# Altium project pca20057.PrjPCB
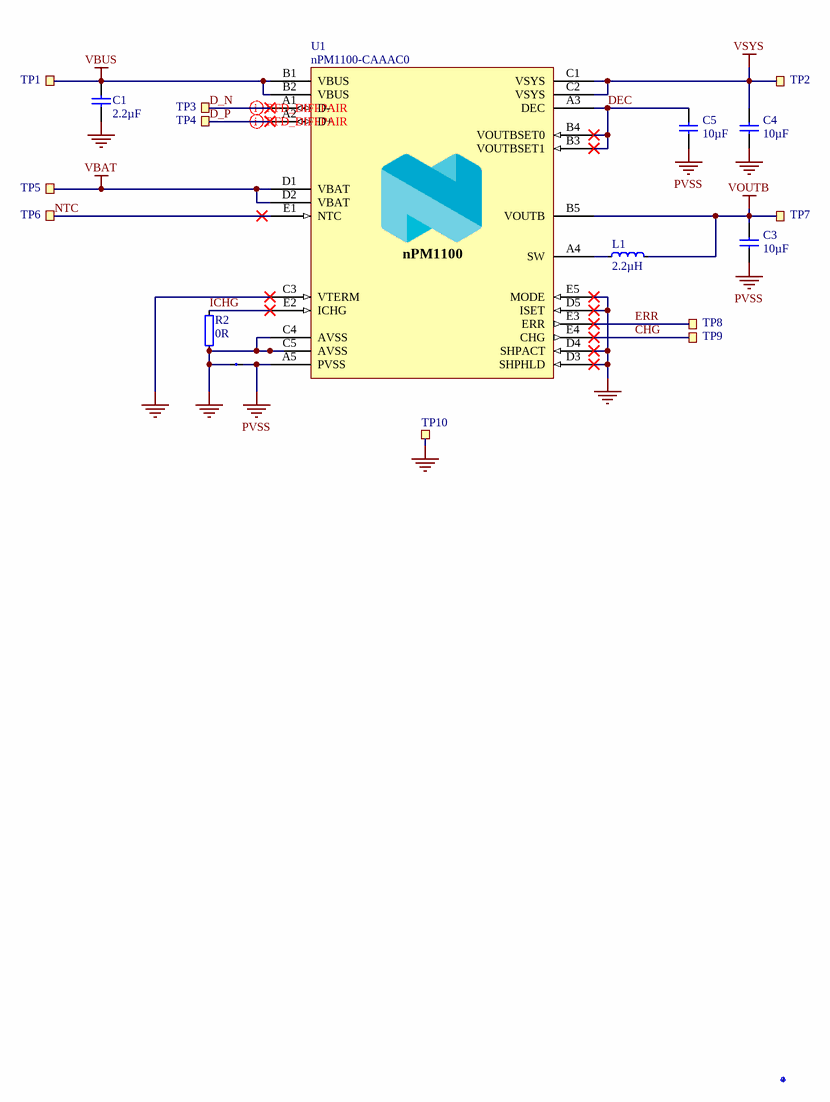
[diagram p0: pca20057-nPM1100.SchDoc]
Auth: GETR; BoardThickness: 1.6mm; BoardTitle: nPM1100 Reference Design Board; NrOfLayers: 2; Organization: Nordic Semiconductor; PCAName: PCA20057; PCBNumber: 400589; PCBRevision: 0166GETR; PCBStackup: 4001; ProjectName: nPM1100 Evaluation Kit; ProjectNumber: 4477; Rev: 1.0.0; SilkscreenColor: White; SoldermaskColor: Blue; SurfaceFinish: ENIG Gold
1 sheet, 19 parts. Net scope: global (net labels, ports and power ports of the same name join across sheets).
Board file: 400589.PcbDoc

## Sheet pca20057-nPM1100.SchDoc: PCA20057 - nPM1100
size A3; Organization: Nordic Semiconductor; DocumentNumber: 1; Revision: 1.0.0; SheetNumber: 1; SheetTotal: 1; Author: GETR; CompanyName: Nordic Semiconductor; DocumentSize: A4; Project Number: 4477; ProjectName: nPM1100 Evaluation Kit

### Parts
C1  2.2µF  [CAPC1608X06L]
C3  10µF  [CAPC1608X06L]
C4  10µF  [CAPC1608X06L]
C5  10µF  [CAPC1608X06L]
Fid1  Fiducial mark  [Fiducial]  (value not drawn)
J1  N.A.  [2 PIN STARPOINT]  (value not drawn)  (net tie, no BOM)
L1  2.2µH  [INDC1608X06L]
R2  0R  [RESC0603X03L_C]
TP1  TP  [TESTPAD-TH - 0.5mm]  (value not drawn)  (no BOM)
TP2  TP  [TESTPAD-TH - 0.5mm]  (value not drawn)  (no BOM)
TP3  TP  [TESTPAD-TH - 0.5mm]  (value not drawn)  (no BOM)
TP4  TP  [TESTPAD-TH - 0.5mm]  (value not drawn)  (no BOM)
TP5  TP  [TESTPAD-TH - 0.5mm]  (value not drawn)  (no BOM)
TP6  TP  [TESTPAD-TH - 0.5mm]  (value not drawn)  (no BOM)
TP7  TP  [TESTPAD-TH - 0.5mm]  (value not drawn)  (no BOM)
TP8  TP  [TESTPAD-TH - 0.5mm]  (value not drawn)  (no BOM)
TP9  TP  [TESTPAD-TH - 0.5mm]  (value not drawn)  (no BOM)
TP10  TP  [TESTPAD-TH - 0.5mm]  (value not drawn)  (no BOM)
U1  nPM1100-CAAAC0  [BGA25C40P5X5_200X200X50]

### Nets
GND: C1.1 C4.1 J1.2 R2.1 TP10.1 U1.C3(VTERM) U1.C4(AVSS) U1.C5(AVSS) U1.D3(SHPHLD) U1.D4(SHPACT) U1.D5(ISET) U1.E5(MODE)
PVSS: C3.1 C5.1 J1.1 U1.A5(PVSS)
VBAT: TP5.1 U1.D1(VBAT) U1.D2(VBAT)
VBUS: C1.2 TP1.1 U1.B1(VBUS) U1.B2(VBUS)
VOUTB: C3.2 L1.2 TP7.1 U1.B5(VOUTB)
VSYS: C4.2 TP2.1 U1.C1(VSYS) U1.C2(VSYS)
CHG: TP9.1 U1.E4(CHG)
D_N: TP3.1 U1.A1(D-)
D_P: TP4.1 U1.A2(D+)
DEC: C5.2 U1.A3(DEC) U1.B3(VOUTBSET1) U1.B4(VOUTBSET0)
ERR: TP8.1 U1.E3(ERR)
ICHG: R2.2 U1.E2(ICHG)
NTC: TP6.1 U1.E1(NTC)
NetL1_1: L1.1 U1.A4(SW)

### Layout directives
differential pair; differential pair class USB: D_N, D_P

### Notes on the sheet
- Size
- Date:
- A3
- Project Number
- Sheet         of
- Revision
- File:
- Drawn By:
- (in symbol nPM1100-CAAAC0) nPM1100

### Library data of the parts
C1 = C0603-2µ2-25V-X5R: Capacitor, Ceramic, X5R, ±10%, 25V; Manufacturer: Murata; Manufacturer Part Number: GRM188R61E225KA12D; Pad Count: 2; Artikkelnr Noca: N.A.; Part Number: C0603-2µ2-25V-X5R; PartId: 100200454; Component Class: Capacitors; Author: rsk; ComponentLink1URL: https://search.murata.co.jp/Ceramy/image/img/A01X/G101/ENG/GRM188R61E225KA12-01.pdf; ComponentLink1Description: Datasheet; ComponentLink2URL: https://www.murata.com/en-global/products/productdetail?partno=GRM188R61E225KA12%23; ComponentLink2Description: Supplier link; HelpURL: N.A.; Footprint Doc: 0603; LatestRevisionDate: 2020-12-16; Published: 2020-12-16; Value: 2.2µF; Note: 25V; Supplier 1: Digi-Key; Supplier Part Number 1: 490-10731-1-ND; Supplier 2: Mouser; Supplier Part Number 2: 81-GRM188R61E225KA2D; Part number IPS: N.A.; Part number Norautron: N.A.
C3-C5 = 0603-10u-10V-X7T-GRM188: CAP CER 10UF 10V X7T 0603; Manufacturer: Murata; Manufacturer Part Number: GRM188D71A106MA73; Part number IPS: 00000004696; Note: 10VDC; Artikkelnr Noca: N.A.; Pad Count: 2; Part Number: 0603-10u-10V-X7T-GRM188; ComponentLink1URL: N.A.; ComponentLink1Description: Datasheet; ComponentLink2URL: N.A.; ComponentLink2Description: Supplier link; HelpURL: https://no.mouser.com/datasheet/2/281/murata_03052018_GRM_Series_1-1310166.pdf; Footprint Doc: 0603; LatestRevisionDate: 2020-10-13; Publisher: Nordic Semiconductor; Published: 2018-09-11; Value: 10µF; Supplier 1: Digi-Key; Supplier Part Number 1: 490-7200-1-ND; Supplier 2: Mouser; Supplier Part Number 2: 81-GRM188D71A106MA3D; Component Class: Capacitors; PartId: 100200414
Fid1 = Fid-Mark: Artikkelnr Noca: N.A.; Pad Count: 1; Part Number: Fid-Mark; Manufacturer: *; Manufacturer Part Number: *; LatestRevisionDate: 2009-12-12; Publisher: Nordic Semiconductor; Published: 2009-12-12; Value: *; Note: *; Footprint Doc: Fiducial; Part number IPS: N.A.; ComponentLink1URL: *; ComponentLink1Description: Datasheet; ComponentLink2URL: *; ComponentLink2Description: Supplier link; HelpURL: *; Supplier 1: *; Supplier Part Number 1: *; Supplier 2: *; Supplier Part Number 2: *; PartId: 100500073; Component Class: Connectors
J1 = 2 pin starpoint: Starpoint; Pad Count: 2; Part Number: 2 pin starpoint; Manufacturer: N.A.; Manufacturer Part Number: N.A.; ComponentLink1URL: N.A.; ComponentLink1Description: Datasheet; ComponentLink2URL: N.A.; ComponentLink2Description: Supplier link; HelpURL: N.A.; Footprint Doc: N.A.; LatestRevisionDate: 2017-08-31; Pin Count: 2; Publisher: Nordic Semiconductor; Published: 2017-08-31; Value: N.A.; Note: N.A.; Supplier 1: N.A.; Supplier Part Number 1: N.A.; Supplier 2: N.A.; Supplier Part Number 2: N.A.; Artikkelnr Noca: N.A.; Part number IPS: N.A.; Component Class: Connectors; PartId: 100500603
L1 = BRL1608T2R2M: FIXED IND 2.2UH 500MA 520 MOHM; Manufacturer: Taiyo Yuden; Pad Count: 2; Note: -40°C ~ 105°C; Artikkelnr Noca: N.A.; Part Number: BRL1608T2R2M; Component Class: Inductors; Manufacturer Part Number: BRL1608T2R2M; ComponentLink1URL: N.A.; ComponentLink1Description: Datasheet; ComponentLink2URL: http://ds.yuden.co.jp/TYCOMPAS/or/detail.do?productNo=BRL1608T2R2M&dataUnit=M; ComponentLink2Description: Supplier link; HelpURL: N.A.; Footprint Doc: 0603; LatestRevisionDate: 2018-04-18; Published: 2018-04-18; Value: 2.2µH; Supplier 1: Digi-Key; Supplier Part Number 1: 587-2899-1-ND; Supplier 2: N.A.; Supplier Part Number 2: N.A.; Part number IPS: N.A.; PartId: 100300091
R2 = R0201-0R: Resistor, ±5%, 0.05W; Manufacturer: N.A.; Part number IPS: 00000003245; Pad Count: 2; Note: Chip Res 5%; Part Number: R0201-0R; PartId: 100100001; Component Class: Resistors; Manufacturer Part Number: N.A.; ComponentLink1URL: N.A.; ComponentLink1Description: Datasheet; ComponentLink2URL: N.A.; ComponentLink2Description: Supplier link; HelpURL: N.A.; Footprint Doc: 0201; LatestRevisionDate: 2017-11-09; Published: 2014-11-13; Value: 0R; Supplier 1: N.A.; Supplier Part Number 1: N.A.; Supplier 2: N.A.; Supplier Part Number 2: N.A.; Artikkelnr Noca: N.A.
TP1-TP10 = Testpoint TH 0.5mm: Testpoint, through hole; Manufacturer: N.A.; Pad Count: 1; Part Number: Testpoint TH 0.5mm; Manufacturer Part Number: N.A.; LatestRevisionDate: 2016-04-22; Published: 2016-04-22; Value: TP; Note: N.A.; Artikkelnr Noca: N.A.; Footprint Doc: N.A.; Part number IPS: N.A.; ComponentLink1URL: N.A.; ComponentLink1Description: Datasheet; ComponentLink2URL: N.A.; ComponentLink2Description: Supplier link; HelpURL: N.A.; Supplier 1: N.A.; Supplier Part Number 1: N.A.; Supplier 2: N.A.; Supplier Part Number 2: N.A.; Component Class: Connectors; PartId: 100500558
U1 = nPM1100-CAAAC0: Li-Ion/Li-Polymer USB battery charger with a high efficiency buck regulator; Manufacturer: Nordic Semiconductor; Note: N.A.; Pad Count: 25; Part Number: nPM1100-CAAAC0; Manufacturer Part Number: nPM1100-CAAAC0; ComponentLink1URL: N.A.; ComponentLink1Description: Datasheet; ComponentLink2URL: N.A.; ComponentLink2Description: Supplier link; HelpURL: N.A.; Footprint Doc: WLCSP-25; LatestRevisionDate: 2021-04-21; Published: 2021-04-21; Value: nPM1100-CAAAC0; Supplier 1: Nordic Semiconductor; Supplier Part Number 1: N.A.; Supplier 2: N.A.; Supplier Part Number 2: N.A.; Artikkelnr Noca: N.A.; Part number IPS: N.A.; Component Class: nRF_Devices; PartId: 102000225; Author: rubr; Part number Norautron: N.A.